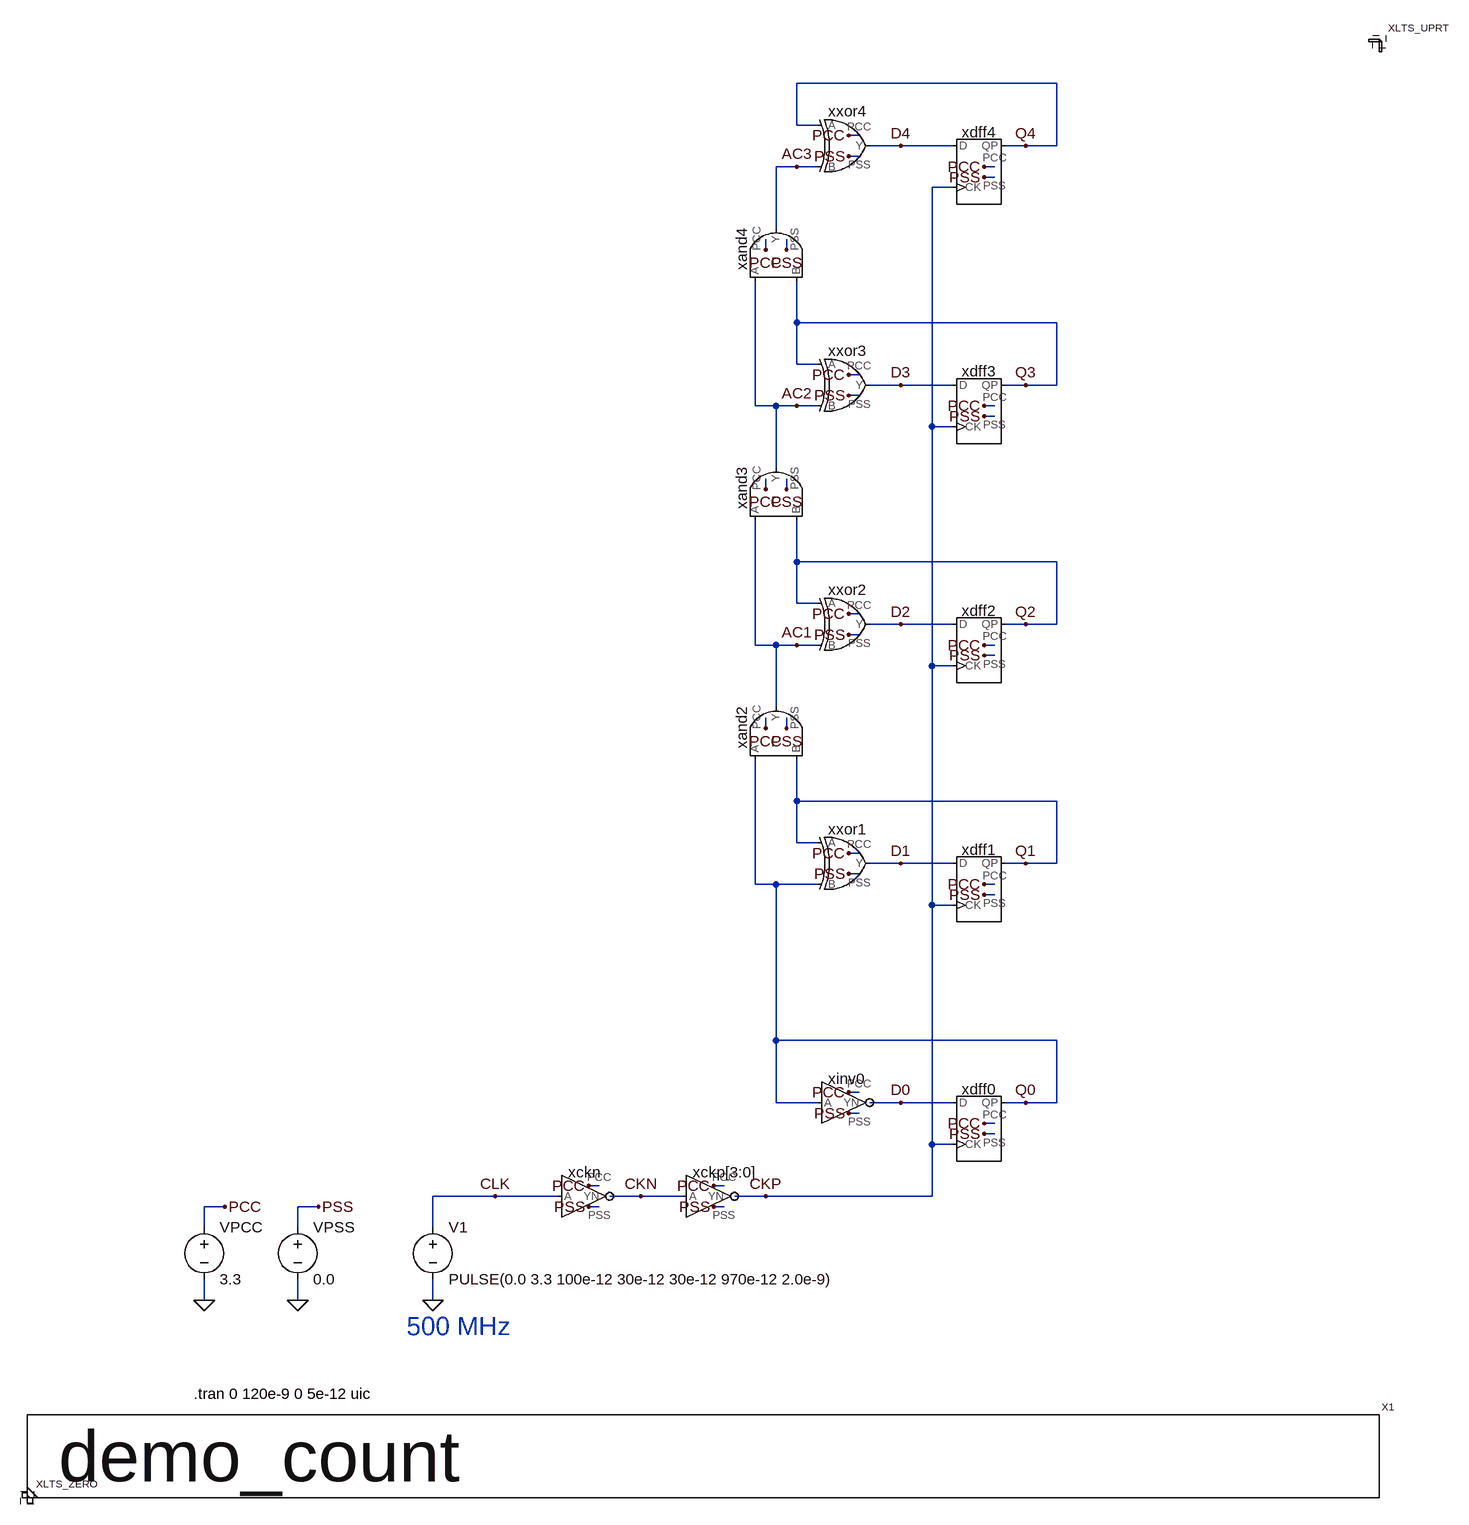
[diagram p0: schematic demo_count.asc]
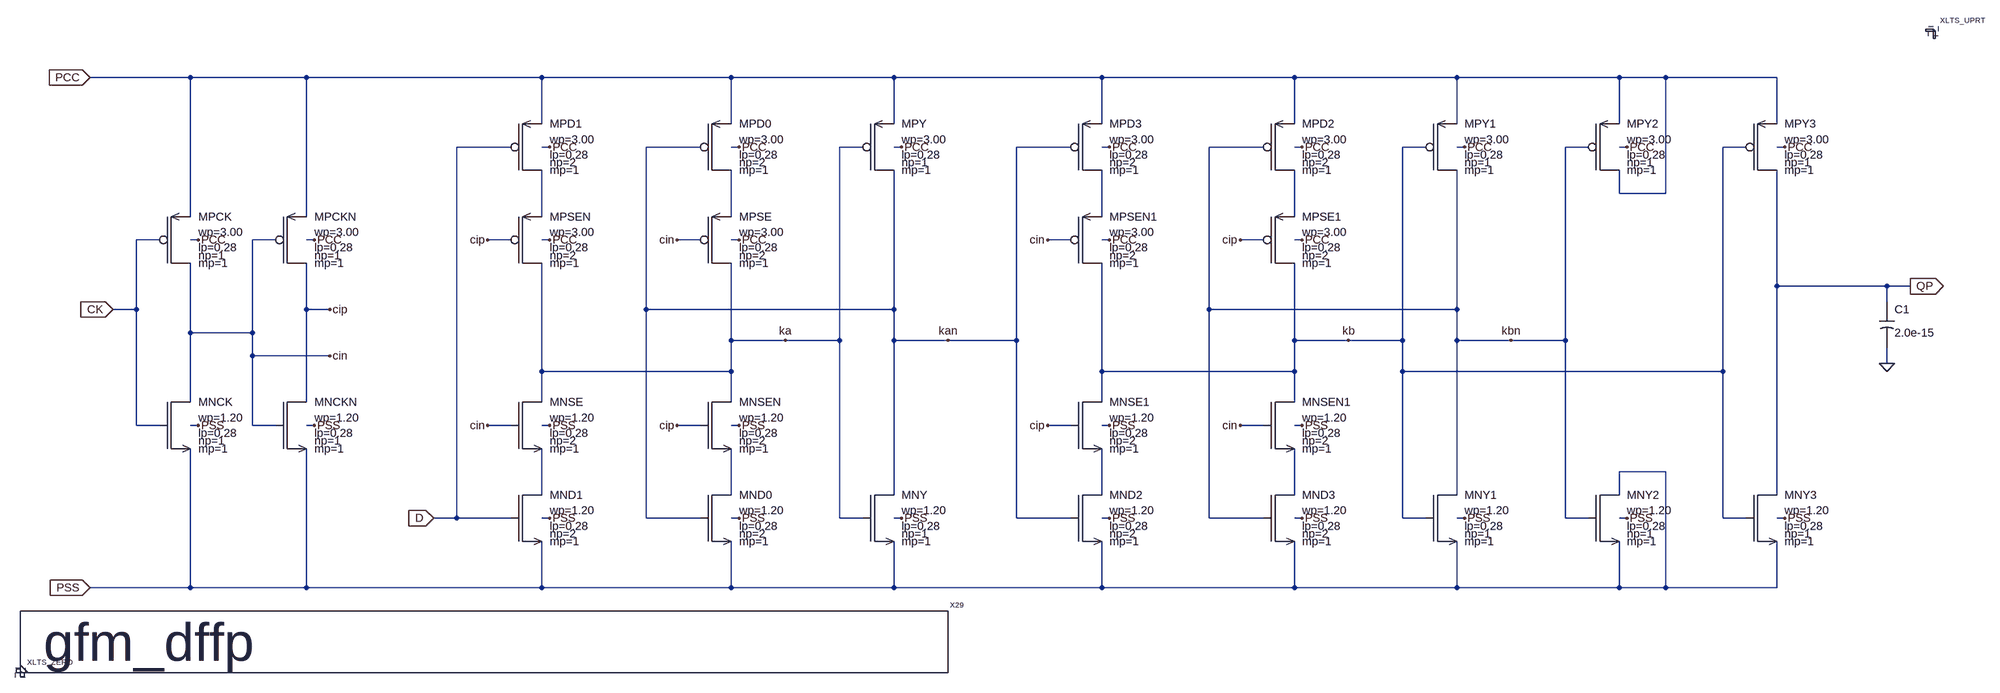
[diagram p1: sub-circuit gfm_dffp.asc]
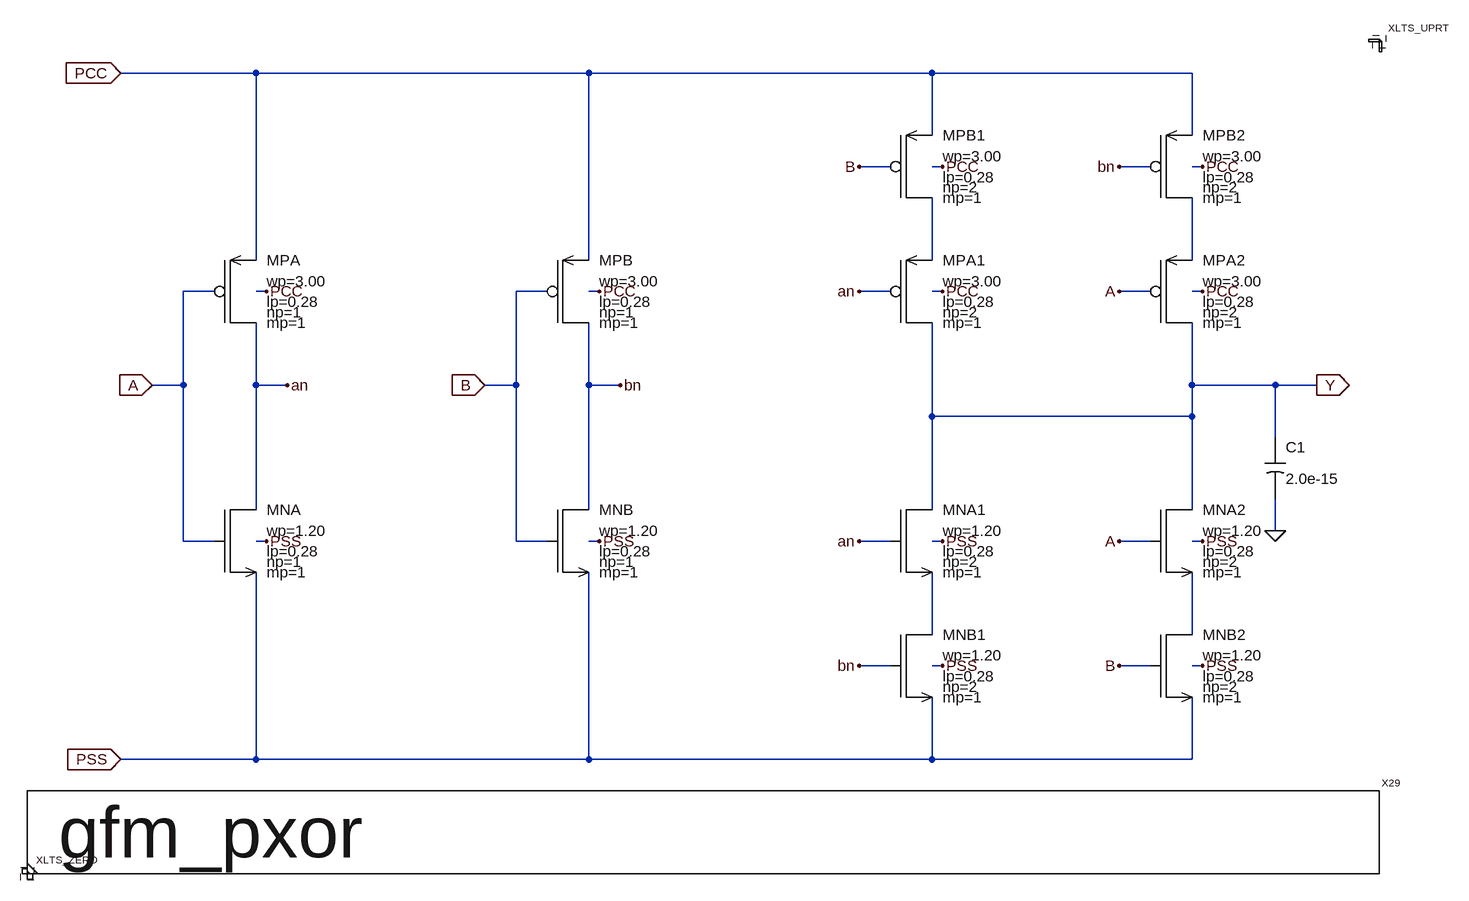
[diagram p2: sub-circuit gfm_pxor.asc]
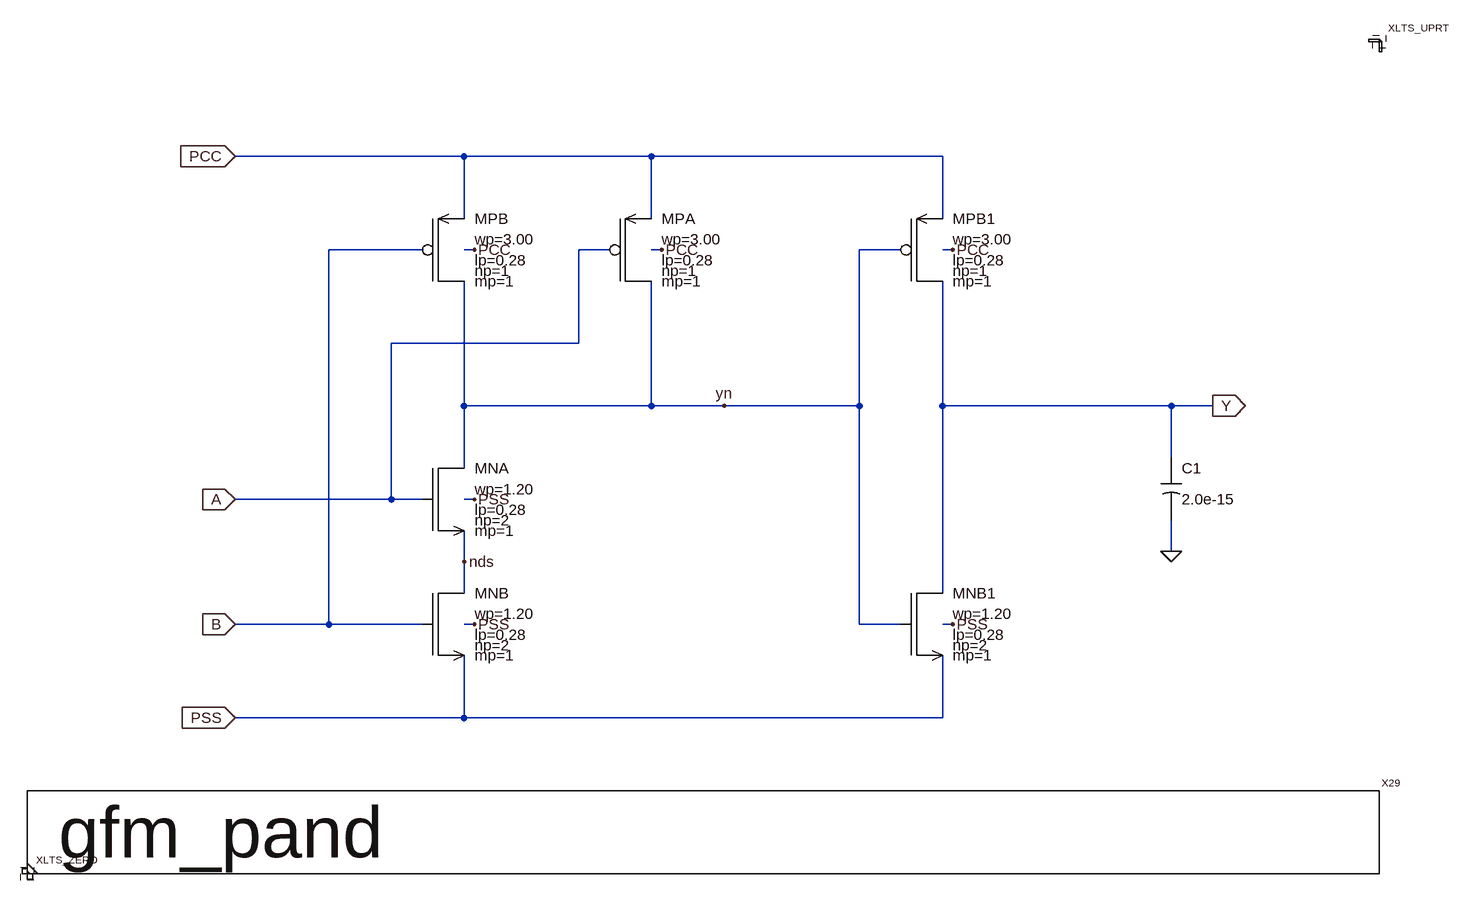
[diagram p3: sub-circuit gfm_pand.asc]
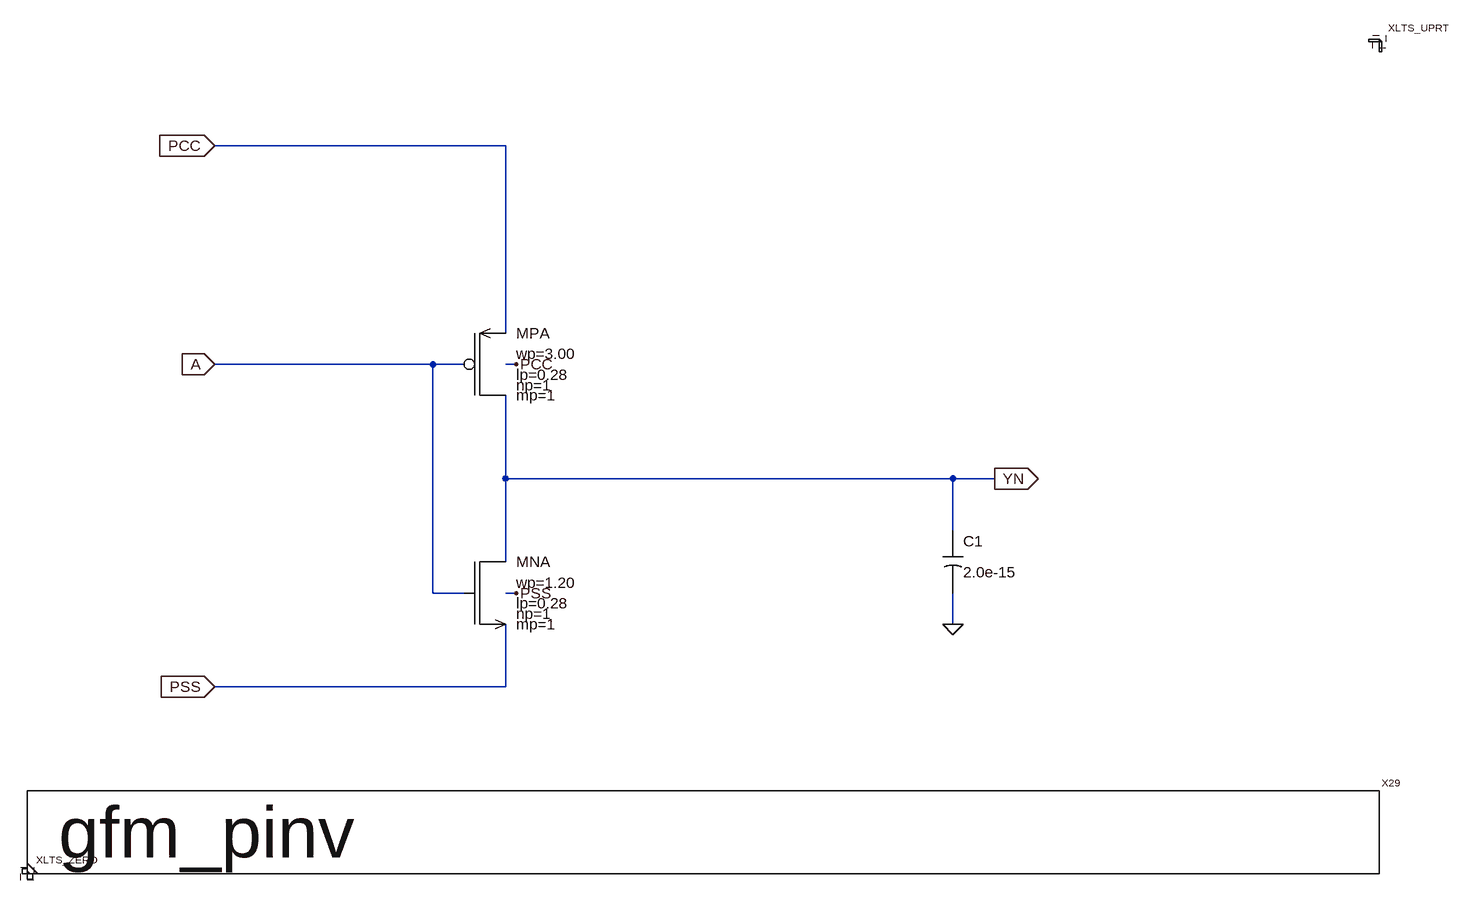
[diagram p4: sub-circuit gfm_pinv.asc]
demo_count.asc, the LTspice schematic file:
Version 4.1
SHEET 1 4824 680
WIRE 1584 -2176 1184 -2176
WIRE 1184 -2112 1184 -2176
WIRE 1216 -2112 1184 -2112
WIRE 1280 -2096 1264 -2096
WIRE 1344 -2080 1296 -2080
WIRE 1424 -2080 1344 -2080
WIRE 1536 -2080 1504 -2080
WIRE 1584 -2080 1584 -2176
WIRE 1584 -2080 1536 -2080
WIRE 1280 -2064 1264 -2064
WIRE 1184 -2048 1152 -2048
WIRE 1216 -2048 1184 -2048
WIRE 1488 -2048 1472 -2048
WIRE 1488 -2032 1472 -2032
WIRE 1424 -2016 1392 -2016
WIRE 1152 -1952 1152 -2048
WIRE 1136 -1920 1136 -1936
WIRE 1168 -1920 1168 -1936
WIRE 1184 -1808 1184 -1872
WIRE 1584 -1808 1184 -1808
WIRE 1184 -1744 1184 -1808
WIRE 1216 -1744 1184 -1744
WIRE 1280 -1728 1264 -1728
WIRE 1344 -1712 1296 -1712
WIRE 1424 -1712 1344 -1712
WIRE 1536 -1712 1504 -1712
WIRE 1584 -1712 1584 -1808
WIRE 1584 -1712 1536 -1712
WIRE 1280 -1696 1264 -1696
WIRE 1120 -1680 1120 -1872
WIRE 1152 -1680 1120 -1680
WIRE 1184 -1680 1152 -1680
WIRE 1216 -1680 1184 -1680
WIRE 1488 -1680 1472 -1680
WIRE 1488 -1664 1472 -1664
WIRE 1392 -1648 1392 -2016
WIRE 1424 -1648 1392 -1648
WIRE 1152 -1584 1152 -1680
WIRE 1136 -1552 1136 -1568
WIRE 1168 -1552 1168 -1568
WIRE 1184 -1440 1184 -1504
WIRE 1584 -1440 1184 -1440
WIRE 1184 -1376 1184 -1440
WIRE 1216 -1376 1184 -1376
WIRE 1280 -1360 1264 -1360
WIRE 1344 -1344 1296 -1344
WIRE 1424 -1344 1344 -1344
WIRE 1536 -1344 1504 -1344
WIRE 1584 -1344 1584 -1440
WIRE 1584 -1344 1536 -1344
WIRE 1280 -1328 1264 -1328
WIRE 1120 -1312 1120 -1504
WIRE 1152 -1312 1120 -1312
WIRE 1184 -1312 1152 -1312
WIRE 1216 -1312 1184 -1312
WIRE 1488 -1312 1472 -1312
WIRE 1488 -1296 1472 -1296
WIRE 1392 -1280 1392 -1648
WIRE 1424 -1280 1392 -1280
WIRE 1152 -1216 1152 -1312
WIRE 1136 -1184 1136 -1200
WIRE 1168 -1184 1168 -1200
WIRE 1184 -1072 1184 -1136
WIRE 1584 -1072 1184 -1072
WIRE 1184 -1008 1184 -1072
WIRE 1216 -1008 1184 -1008
WIRE 1280 -992 1264 -992
WIRE 1344 -976 1296 -976
WIRE 1424 -976 1344 -976
WIRE 1536 -976 1504 -976
WIRE 1584 -976 1584 -1072
WIRE 1584 -976 1536 -976
WIRE 1280 -960 1264 -960
WIRE 1120 -944 1120 -1136
WIRE 1152 -944 1120 -944
WIRE 1216 -944 1152 -944
WIRE 1488 -944 1472 -944
WIRE 1488 -928 1472 -928
WIRE 1392 -912 1392 -1280
WIRE 1424 -912 1392 -912
WIRE 1152 -704 1152 -944
WIRE 1584 -704 1152 -704
WIRE 1280 -624 1264 -624
WIRE 1152 -608 1152 -704
WIRE 1216 -608 1152 -608
WIRE 1344 -608 1296 -608
WIRE 1424 -608 1344 -608
WIRE 1536 -608 1504 -608
WIRE 1584 -608 1584 -704
WIRE 1584 -608 1536 -608
WIRE 1280 -592 1264 -592
WIRE 1488 -576 1472 -576
WIRE 1488 -560 1472 -560
WIRE 1392 -544 1392 -912
WIRE 1424 -544 1392 -544
WIRE 880 -480 864 -480
WIRE 1072 -480 1056 -480
WIRE 720 -464 624 -464
WIRE 816 -464 720 -464
WIRE 944 -464 896 -464
WIRE 1008 -464 944 -464
WIRE 1136 -464 1088 -464
WIRE 1392 -464 1392 -544
WIRE 1392 -464 1136 -464
WIRE 304 -448 272 -448
WIRE 448 -448 416 -448
WIRE 880 -448 864 -448
WIRE 1072 -448 1056 -448
WIRE 272 -416 272 -448
WIRE 416 -416 416 -448
WIRE 624 -416 624 -464
WIRE 272 -304 272 -336
WIRE 416 -304 416 -336
WIRE 624 -304 624 -336
FLAG 1472 -944 PCC
FLAG 1472 -928 PSS
FLAG 1344 -608 D0
FLAG 1536 -608 Q0
FLAG 1472 -1312 PCC
FLAG 1472 -1296 PSS
FLAG 1344 -976 D1
FLAG 1264 -1360 PCC
FLAG 1264 -1328 PSS
FLAG 1136 -1184 PCC
FLAG 1168 -1184 PSS
FLAG 1536 -976 Q1
FLAG 1472 -1680 PCC
FLAG 1472 -1664 PSS
FLAG 1344 -1344 D2
FLAG 1264 -1728 PCC
FLAG 1264 -1696 PSS
FLAG 1184 -1312 AC1
FLAG 1136 -1552 PCC
FLAG 1168 -1552 PSS
FLAG 1536 -1344 Q2
FLAG 1472 -2048 PCC
FLAG 1472 -2032 PSS
FLAG 1344 -1712 D3
FLAG 1264 -2096 PCC
FLAG 1264 -2064 PSS
FLAG 1184 -1680 AC2
FLAG 1136 -1920 PCC
FLAG 1168 -1920 PSS
FLAG 1536 -1712 Q3
FLAG 1344 -2080 D4
FLAG 1264 -992 PCC
FLAG 1264 -960 PSS
FLAG 1184 -2048 AC3
FLAG 1536 -2080 Q4
FLAG 1264 -624 PCC
FLAG 1264 -592 PSS
FLAG 1472 -576 PCC
FLAG 1472 -560 PSS
FLAG 272 -304 0
FLAG 304 -448 PCC
FLAG 416 -304 0
FLAG 448 -448 PSS
FLAG 624 -304 0
FLAG 944 -464 CKN
FLAG 864 -480 PCC
FLAG 864 -448 PSS
FLAG 1136 -464 CKP
FLAG 1056 -480 PCC
FLAG 1056 -448 PSS
FLAG 720 -464 CLK
SYMBOL BD_GTitleLTS 0 0 R0
SYMATTR SpiceModel demo_count
SYMATTR InstName X1
SYMBOL BD_ZERO 0 0 R0
SYMATTR InstName XLTS_ZERO
SYMBOL BD_UPRT 2080 -2240 R0
SYMATTR InstName XLTS_UPRT
SYMBOL gfm_dffp 1424 -944 R0
SYMATTR InstName xdff1
SYMBOL gfm_dffp 1424 -1312 R0
SYMATTR InstName xdff2
SYMBOL gfm_pxor 1216 -1344 R0
SYMATTR InstName xxor2
SYMBOL gfm_pand 1152 -1136 R270
SYMATTR InstName xand2
SYMBOL gfm_dffp 1424 -1680 R0
SYMATTR InstName xdff3
SYMBOL gfm_pxor 1216 -1712 R0
SYMATTR InstName xxor3
SYMBOL gfm_pand 1152 -1504 R270
SYMATTR InstName xand3
SYMBOL gfm_dffp 1424 -2048 R0
SYMATTR InstName xdff4
SYMBOL gfm_pxor 1216 -2080 R0
SYMATTR InstName xxor4
SYMBOL gfm_pand 1152 -1872 R270
SYMATTR InstName xand4
SYMBOL gfm_pxor 1216 -976 R0
SYMATTR InstName xxor1
SYMBOL gfm_pinv 1216 -608 R0
SYMATTR InstName xinv0
SYMBOL gfm_dffp 1424 -576 R0
SYMATTR InstName xdff0
SYMBOL voltage 272 -432 R0
SYMATTR InstName VPCC
SYMATTR Value 3.3
SYMBOL voltage 416 -432 R0
SYMATTR InstName VPSS
SYMATTR Value 0.0
SYMBOL voltage 624 -432 R0
WINDOW 123 0 0 Left 0
WINDOW 39 0 0 Left 0
SYMATTR InstName V1
SYMATTR Value PULSE(0.0 3.3 100e-12 30e-12 30e-12 970e-12 2.0e-9)
SYMBOL gfm_pinv 816 -464 R0
SYMATTR InstName xckn
SYMBOL gfm_pinv 1008 -464 R0
SYMATTR InstName xckp[3:0]
TEXT 584 -264 Left 4 ;500 MHz
TEXT 256 -160 Left 2 !.tran 0 120e-9 0 5e-12 uic

gfm_dffp.asc, the sub-circuit schematic file:
Version 4
SHEET 1 4876 4336
WIRE 352 -1232 144 -1232
WIRE 592 -1232 352 -1232
WIRE 1232 -1232 592 -1232
WIRE 1632 -1232 1232 -1232
WIRE 1968 -1232 1632 -1232
WIRE 2768 -1232 1968 -1232
WIRE 3168 -1232 2768 -1232
WIRE 3504 -1232 3168 -1232
WIRE 3840 -1232 3504 -1232
WIRE 3936 -1232 3840 -1232
WIRE 4176 -1232 3936 -1232
WIRE 1232 -1136 1232 -1232
WIRE 1632 -1136 1632 -1232
WIRE 1968 -1136 1968 -1232
WIRE 2768 -1136 2768 -1232
WIRE 3168 -1136 3168 -1232
WIRE 3504 -1136 3504 -1232
WIRE 3840 -1136 3840 -1232
WIRE 4176 -1136 4176 -1232
WIRE 1168 -1088 1056 -1088
WIRE 1248 -1088 1232 -1088
WIRE 1568 -1088 1456 -1088
WIRE 1648 -1088 1632 -1088
WIRE 1904 -1088 1856 -1088
WIRE 1984 -1088 1968 -1088
WIRE 2704 -1088 2592 -1088
WIRE 2784 -1088 2768 -1088
WIRE 3104 -1088 2992 -1088
WIRE 3184 -1088 3168 -1088
WIRE 3440 -1088 3392 -1088
WIRE 3520 -1088 3504 -1088
WIRE 3776 -1088 3728 -1088
WIRE 3856 -1088 3840 -1088
WIRE 4112 -1088 4064 -1088
WIRE 4192 -1088 4176 -1088
WIRE 3840 -992 3840 -1040
WIRE 3936 -992 3936 -1232
WIRE 3936 -992 3840 -992
WIRE 352 -944 352 -1232
WIRE 592 -944 592 -1232
WIRE 1232 -944 1232 -1040
WIRE 1632 -944 1632 -1040
WIRE 2768 -944 2768 -1040
WIRE 3168 -944 3168 -1040
WIRE 288 -896 240 -896
WIRE 368 -896 352 -896
WIRE 528 -896 480 -896
WIRE 608 -896 592 -896
WIRE 1168 -896 1120 -896
WIRE 1248 -896 1232 -896
WIRE 1568 -896 1520 -896
WIRE 1648 -896 1632 -896
WIRE 2704 -896 2656 -896
WIRE 2784 -896 2768 -896
WIRE 3104 -896 3056 -896
WIRE 3184 -896 3168 -896
WIRE 4176 -800 4176 -1040
WIRE 4560 -800 4176 -800
WIRE 4608 -800 4560 -800
WIRE 4560 -768 4560 -800
WIRE 240 -752 240 -896
WIRE 240 -752 192 -752
WIRE 592 -752 592 -848
WIRE 640 -752 592 -752
WIRE 1456 -752 1456 -1088
WIRE 1968 -752 1968 -1040
WIRE 1968 -752 1456 -752
WIRE 2992 -752 2992 -1088
WIRE 3504 -752 3504 -1040
WIRE 3504 -752 2992 -752
WIRE 352 -704 352 -848
WIRE 480 -704 480 -896
WIRE 480 -704 352 -704
WIRE 1632 -688 1632 -848
WIRE 1744 -688 1632 -688
WIRE 1856 -688 1856 -1088
WIRE 1856 -688 1744 -688
WIRE 1968 -688 1968 -752
WIRE 2080 -688 1968 -688
WIRE 2592 -688 2592 -1088
WIRE 2592 -688 2080 -688
WIRE 3168 -688 3168 -848
WIRE 3280 -688 3168 -688
WIRE 3392 -688 3392 -1088
WIRE 3392 -688 3280 -688
WIRE 3504 -688 3504 -752
WIRE 3616 -688 3504 -688
WIRE 3728 -688 3728 -1088
WIRE 3728 -688 3616 -688
WIRE 480 -656 480 -704
WIRE 640 -656 480 -656
WIRE 4560 -640 4560 -672
WIRE 1232 -624 1232 -848
WIRE 1632 -624 1632 -688
WIRE 1632 -624 1232 -624
WIRE 2768 -624 2768 -848
WIRE 3168 -624 3168 -688
WIRE 3168 -624 2768 -624
WIRE 3392 -624 3392 -688
WIRE 4064 -624 4064 -1088
WIRE 4064 -624 3392 -624
WIRE 352 -560 352 -704
WIRE 592 -560 592 -752
WIRE 1232 -560 1232 -624
WIRE 1632 -560 1632 -624
WIRE 2768 -560 2768 -624
WIRE 3168 -560 3168 -624
WIRE 240 -512 240 -752
WIRE 288 -512 240 -512
WIRE 368 -512 352 -512
WIRE 480 -512 480 -656
WIRE 528 -512 480 -512
WIRE 608 -512 592 -512
WIRE 1168 -512 1120 -512
WIRE 1248 -512 1232 -512
WIRE 1568 -512 1520 -512
WIRE 1648 -512 1632 -512
WIRE 2704 -512 2656 -512
WIRE 2784 -512 2768 -512
WIRE 3104 -512 3056 -512
WIRE 3184 -512 3168 -512
WIRE 3936 -416 3840 -416
WIRE 1232 -368 1232 -464
WIRE 1632 -368 1632 -464
WIRE 1968 -368 1968 -688
WIRE 2768 -368 2768 -464
WIRE 3168 -368 3168 -464
WIRE 3504 -368 3504 -688
WIRE 3840 -368 3840 -416
WIRE 4176 -368 4176 -800
WIRE 1056 -320 1056 -1088
WIRE 1056 -320 1008 -320
WIRE 1168 -320 1056 -320
WIRE 1248 -320 1232 -320
WIRE 1456 -320 1456 -752
WIRE 1568 -320 1456 -320
WIRE 1648 -320 1632 -320
WIRE 1856 -320 1856 -688
WIRE 1904 -320 1856 -320
WIRE 1984 -320 1968 -320
WIRE 2592 -320 2592 -688
WIRE 2704 -320 2592 -320
WIRE 2784 -320 2768 -320
WIRE 2992 -320 2992 -752
WIRE 3104 -320 2992 -320
WIRE 3184 -320 3168 -320
WIRE 3392 -320 3392 -624
WIRE 3440 -320 3392 -320
WIRE 3520 -320 3504 -320
WIRE 3728 -320 3728 -688
WIRE 3776 -320 3728 -320
WIRE 3856 -320 3840 -320
WIRE 4064 -320 4064 -624
WIRE 4112 -320 4064 -320
WIRE 4192 -320 4176 -320
WIRE 352 -176 352 -464
WIRE 352 -176 144 -176
WIRE 592 -176 592 -464
WIRE 592 -176 352 -176
WIRE 1232 -176 1232 -272
WIRE 1232 -176 592 -176
WIRE 1632 -176 1632 -272
WIRE 1632 -176 1232 -176
WIRE 1968 -176 1968 -272
WIRE 1968 -176 1632 -176
WIRE 2768 -176 2768 -272
WIRE 2768 -176 1968 -176
WIRE 3168 -176 3168 -272
WIRE 3168 -176 2768 -176
WIRE 3504 -176 3504 -272
WIRE 3504 -176 3168 -176
WIRE 3840 -176 3840 -272
WIRE 3840 -176 3504 -176
WIRE 3936 -176 3936 -416
WIRE 3936 -176 3840 -176
WIRE 4176 -176 4176 -272
WIRE 4176 -176 3936 -176
FLAG 144 -176 PSS
IOPIN 144 -176 In
FLAG 144 -1232 PCC
IOPIN 144 -1232 In
FLAG 192 -752 CK
IOPIN 192 -752 In
FLAG 1008 -320 D
IOPIN 1008 -320 In
FLAG 1648 -512 PSS
FLAG 1520 -512 cip
FLAG 1248 -512 PSS
FLAG 1120 -512 cin
FLAG 1648 -896 PCC
FLAG 1520 -896 cin
FLAG 1248 -896 PCC
FLAG 1120 -896 cip
FLAG 1648 -1088 PCC
FLAG 1248 -1088 PCC
FLAG 1648 -320 PSS
FLAG 1248 -320 PSS
FLAG 368 -512 PSS
FLAG 368 -896 PCC
FLAG 608 -512 PSS
FLAG 608 -896 PCC
FLAG 640 -752 cip
FLAG 640 -656 cin
FLAG 1984 -1088 PCC
FLAG 1984 -320 PSS
FLAG 1744 -688 ka
FLAG 3184 -512 PSS
FLAG 3056 -512 cin
FLAG 2784 -512 PSS
FLAG 2656 -512 cip
FLAG 3184 -896 PCC
FLAG 3056 -896 cip
FLAG 2784 -896 PCC
FLAG 2656 -896 cin
FLAG 3184 -1088 PCC
FLAG 2784 -1088 PCC
FLAG 3184 -320 PSS
FLAG 2784 -320 PSS
FLAG 3520 -1088 PCC
FLAG 3520 -320 PSS
FLAG 3280 -688 kb
FLAG 2080 -688 kan
FLAG 3856 -1088 PCC
FLAG 3856 -320 PSS
FLAG 4192 -1088 PCC
FLAG 4192 -320 PSS
FLAG 3616 -688 kbn
FLAG 4608 -800 QP
IOPIN 4608 -800 Out
FLAG 4560 -640 0
SYMBOL gfmcu_nmos3p3 1168 -512 R0
SYMATTR InstName MNSE
SYMATTR SpiceLine np=2
SYMATTR Value wp=1.20
SYMATTR Value2 lp=0.28
SYMBOL gfmcu_nmos3p3 1168 -320 R0
SYMATTR InstName MND1
SYMATTR SpiceLine np=2
SYMATTR Value wp=1.20
SYMATTR Value2 lp=0.28
SYMBOL gfmcu_pmos3p3 1568 -896 R0
SYMATTR InstName MPSE
SYMATTR SpiceLine np=2
SYMATTR Value wp=3.00
SYMATTR Value2 lp=0.28
SYMBOL gfmcu_pmos3p3 1568 -1088 R0
SYMATTR InstName MPD0
SYMATTR SpiceLine np=2
SYMATTR Value wp=3.00
SYMATTR Value2 lp=0.28
SYMBOL gfmcu_pmos3p3 1168 -896 R0
SYMATTR InstName MPSEN
SYMATTR SpiceLine np=2
SYMATTR Value wp=3.00
SYMATTR Value2 lp=0.28
SYMBOL gfmcu_pmos3p3 1168 -1088 R0
SYMATTR InstName MPD1
SYMATTR SpiceLine np=2
SYMATTR Value wp=3.00
SYMATTR Value2 lp=0.28
SYMBOL BD_GTitleLTS 0 0 R0
SYMATTR InstName X29
SYMATTR SpiceModel gfm_dffp
SYMBOL gfmcu_nmos3p3 1568 -512 R0
SYMATTR InstName MNSEN
SYMATTR SpiceLine np=2
SYMATTR Value wp=1.20
SYMATTR Value2 lp=0.28
SYMBOL gfmcu_nmos3p3 1568 -320 R0
SYMATTR InstName MND0
SYMATTR SpiceLine np=2
SYMATTR Value wp=1.20
SYMATTR Value2 lp=0.28
SYMBOL gfmcu_nmos3p3 288 -512 R0
SYMATTR InstName MNCK
SYMATTR Value wp=1.20
SYMATTR Value2 lp=0.28
SYMBOL gfmcu_pmos3p3 288 -896 R0
SYMATTR InstName MPCK
SYMATTR Value wp=3.00
SYMATTR Value2 lp=0.28
SYMBOL gfmcu_nmos3p3 528 -512 R0
SYMATTR InstName MNCKN
SYMATTR Value wp=1.20
SYMATTR Value2 lp=0.28
SYMBOL gfmcu_pmos3p3 528 -896 R0
SYMATTR InstName MPCKN
SYMATTR Value wp=3.00
SYMATTR Value2 lp=0.28
SYMBOL gfmcu_pmos3p3 1904 -1088 R0
SYMATTR InstName MPY
SYMATTR Value wp=3.00
SYMATTR Value2 lp=0.28
SYMBOL gfmcu_nmos3p3 1904 -320 R0
SYMATTR InstName MNY
SYMATTR Value wp=1.20
SYMATTR Value2 lp=0.28
SYMBOL gfmcu_nmos3p3 2704 -512 R0
SYMATTR InstName MNSE1
SYMATTR SpiceLine np=2
SYMATTR Value wp=1.20
SYMATTR Value2 lp=0.28
SYMBOL gfmcu_nmos3p3 2704 -320 R0
SYMATTR InstName MND2
SYMATTR SpiceLine np=2
SYMATTR Value wp=1.20
SYMATTR Value2 lp=0.28
SYMBOL gfmcu_pmos3p3 3104 -896 R0
SYMATTR InstName MPSE1
SYMATTR SpiceLine np=2
SYMATTR Value wp=3.00
SYMATTR Value2 lp=0.28
SYMBOL gfmcu_pmos3p3 3104 -1088 R0
SYMATTR InstName MPD2
SYMATTR SpiceLine np=2
SYMATTR Value wp=3.00
SYMATTR Value2 lp=0.28
SYMBOL gfmcu_pmos3p3 2704 -896 R0
SYMATTR InstName MPSEN1
SYMATTR SpiceLine np=2
SYMATTR Value wp=3.00
SYMATTR Value2 lp=0.28
SYMBOL gfmcu_pmos3p3 2704 -1088 R0
SYMATTR InstName MPD3
SYMATTR SpiceLine np=2
SYMATTR Value wp=3.00
SYMATTR Value2 lp=0.28
SYMBOL gfmcu_nmos3p3 3104 -512 R0
SYMATTR InstName MNSEN1
SYMATTR SpiceLine np=2
SYMATTR Value wp=1.20
SYMATTR Value2 lp=0.28
SYMBOL gfmcu_nmos3p3 3104 -320 R0
SYMATTR InstName MND3
SYMATTR SpiceLine np=2
SYMATTR Value wp=1.20
SYMATTR Value2 lp=0.28
SYMBOL gfmcu_pmos3p3 3440 -1088 R0
SYMATTR InstName MPY1
SYMATTR Value wp=3.00
SYMATTR Value2 lp=0.28
SYMBOL gfmcu_nmos3p3 3440 -320 R0
SYMATTR InstName MNY1
SYMATTR Value wp=1.20
SYMATTR Value2 lp=0.28
SYMBOL gfmcu_pmos3p3 3776 -1088 R0
SYMATTR InstName MPY2
SYMATTR Value wp=3.00
SYMATTR Value2 lp=0.28
SYMBOL gfmcu_nmos3p3 3776 -320 R0
SYMATTR InstName MNY2
SYMATTR Value wp=1.20
SYMATTR Value2 lp=0.28
SYMBOL gfmcu_pmos3p3 4112 -1088 R0
SYMATTR InstName MPY3
SYMATTR Value wp=3.00
SYMATTR Value2 lp=0.28
SYMBOL gfmcu_nmos3p3 4112 -320 R0
SYMATTR InstName MNY3
SYMATTR Value wp=1.20
SYMATTR Value2 lp=0.28
SYMBOL gcap 4560 -768 R0
SYMATTR InstName C1
SYMATTR Value 2.0e-15
SYMBOL BD_ZERO 0 0 R0
SYMATTR InstName XLTS_ZERO
SYMBOL BD_UPRT 4656 -1328 R0
SYMATTR InstName XLTS_UPRT

gfm_pxor.asc, the sub-circuit schematic file:
Version 4
SHEET 1 4552 4336
WIRE 352 -1232 144 -1232
WIRE 864 -1232 352 -1232
WIRE 1392 -1232 864 -1232
WIRE 1792 -1232 1392 -1232
WIRE 1392 -1136 1392 -1232
WIRE 1792 -1136 1792 -1232
WIRE 1328 -1088 1280 -1088
WIRE 1408 -1088 1392 -1088
WIRE 1728 -1088 1680 -1088
WIRE 1808 -1088 1792 -1088
WIRE 352 -944 352 -1232
WIRE 864 -944 864 -1232
WIRE 1392 -944 1392 -1040
WIRE 1792 -944 1792 -1040
WIRE 288 -896 240 -896
WIRE 368 -896 352 -896
WIRE 800 -896 752 -896
WIRE 880 -896 864 -896
WIRE 1328 -896 1280 -896
WIRE 1408 -896 1392 -896
WIRE 1728 -896 1680 -896
WIRE 1808 -896 1792 -896
WIRE 240 -752 240 -896
WIRE 240 -752 192 -752
WIRE 352 -752 352 -848
WIRE 400 -752 352 -752
WIRE 752 -752 752 -896
WIRE 752 -752 704 -752
WIRE 864 -752 864 -848
WIRE 912 -752 864 -752
WIRE 1792 -752 1792 -848
WIRE 1920 -752 1792 -752
WIRE 1984 -752 1920 -752
WIRE 1392 -704 1392 -848
WIRE 1792 -704 1792 -752
WIRE 1792 -704 1392 -704
WIRE 1920 -672 1920 -752
WIRE 352 -560 352 -752
WIRE 864 -560 864 -752
WIRE 1392 -560 1392 -704
WIRE 1792 -560 1792 -704
WIRE 1920 -528 1920 -576
WIRE 240 -512 240 -752
WIRE 288 -512 240 -512
WIRE 368 -512 352 -512
WIRE 752 -512 752 -752
WIRE 800 -512 752 -512
WIRE 880 -512 864 -512
WIRE 1328 -512 1280 -512
WIRE 1408 -512 1392 -512
WIRE 1728 -512 1680 -512
WIRE 1808 -512 1792 -512
WIRE 1392 -368 1392 -464
WIRE 1792 -368 1792 -464
WIRE 1328 -320 1280 -320
WIRE 1408 -320 1392 -320
WIRE 1728 -320 1680 -320
WIRE 1808 -320 1792 -320
WIRE 352 -176 352 -464
WIRE 352 -176 144 -176
WIRE 864 -176 864 -464
WIRE 864 -176 352 -176
WIRE 1392 -176 1392 -272
WIRE 1392 -176 864 -176
WIRE 1792 -176 1792 -272
WIRE 1792 -176 1392 -176
FLAG 144 -176 PSS
IOPIN 144 -176 In
FLAG 144 -1232 PCC
IOPIN 144 -1232 In
FLAG 192 -752 A
IOPIN 192 -752 In
FLAG 1984 -752 Y
IOPIN 1984 -752 Out
FLAG 1920 -528 0
FLAG 1808 -512 PSS
FLAG 1280 -512 an
FLAG 1408 -512 PSS
FLAG 1680 -512 A
FLAG 1808 -896 PCC
FLAG 1280 -896 an
FLAG 1408 -896 PCC
FLAG 1680 -896 A
FLAG 1808 -1088 PCC
FLAG 1408 -1088 PCC
FLAG 1808 -320 PSS
FLAG 1408 -320 PSS
FLAG 368 -512 PSS
FLAG 368 -896 PCC
FLAG 880 -512 PSS
FLAG 880 -896 PCC
FLAG 400 -752 an
FLAG 704 -752 B
IOPIN 704 -752 In
FLAG 912 -752 bn
FLAG 1280 -1088 B
FLAG 1280 -320 bn
FLAG 1680 -320 B
FLAG 1680 -1088 bn
SYMBOL gfmcu_nmos3p3 1328 -512 R0
SYMATTR InstName MNA1
SYMATTR SpiceLine np=2
SYMATTR Value wp=1.20
SYMATTR Value2 lp=0.28
SYMBOL gfmcu_nmos3p3 1328 -320 R0
SYMATTR InstName MNB1
SYMATTR SpiceLine np=2
SYMATTR Value wp=1.20
SYMATTR Value2 lp=0.28
SYMBOL gcap 1920 -672 R0
SYMATTR InstName C1
SYMATTR Value 2.0e-15
SYMBOL gfmcu_pmos3p3 1728 -896 R0
SYMATTR InstName MPA2
SYMATTR SpiceLine np=2
SYMATTR Value wp=3.00
SYMATTR Value2 lp=0.28
SYMBOL gfmcu_pmos3p3 1728 -1088 R0
SYMATTR InstName MPB2
SYMATTR SpiceLine np=2
SYMATTR Value wp=3.00
SYMATTR Value2 lp=0.28
SYMBOL gfmcu_pmos3p3 1328 -896 R0
SYMATTR InstName MPA1
SYMATTR SpiceLine np=2
SYMATTR Value wp=3.00
SYMATTR Value2 lp=0.28
SYMBOL gfmcu_pmos3p3 1328 -1088 R0
SYMATTR InstName MPB1
SYMATTR SpiceLine np=2
SYMATTR Value wp=3.00
SYMATTR Value2 lp=0.28
SYMBOL BD_GTitleLTS 0 0 R0
SYMATTR InstName X29
SYMATTR SpiceModel gfm_pxor
SYMBOL gfmcu_nmos3p3 1728 -512 R0
SYMATTR InstName MNA2
SYMATTR SpiceLine np=2
SYMATTR Value wp=1.20
SYMATTR Value2 lp=0.28
SYMBOL gfmcu_nmos3p3 1728 -320 R0
SYMATTR InstName MNB2
SYMATTR SpiceLine np=2
SYMATTR Value wp=1.20
SYMATTR Value2 lp=0.28
SYMBOL gfmcu_nmos3p3 288 -512 R0
SYMATTR InstName MNA
SYMATTR Value wp=1.20
SYMATTR Value2 lp=0.28
SYMBOL gfmcu_pmos3p3 288 -896 R0
SYMATTR InstName MPA
SYMATTR Value wp=3.00
SYMATTR Value2 lp=0.28
SYMBOL gfmcu_nmos3p3 800 -512 R0
SYMATTR InstName MNB
SYMATTR Value wp=1.20
SYMATTR Value2 lp=0.28
SYMBOL gfmcu_pmos3p3 800 -896 R0
SYMATTR InstName MPB
SYMATTR Value wp=3.00
SYMATTR Value2 lp=0.28
SYMBOL BD_ZERO 0 0 R0
SYMATTR InstName XLTS_ZERO
SYMBOL BD_UPRT 2080 -1280 R0
SYMATTR InstName XLTS_UPRT

gfm_pand.asc, the sub-circuit schematic file:
Version 4
SHEET 1 4552 4336
WIRE 672 -1104 320 -1104
WIRE 960 -1104 672 -1104
WIRE 1408 -1104 960 -1104
WIRE 672 -1008 672 -1104
WIRE 960 -1008 960 -1104
WIRE 1408 -1008 1408 -1104
WIRE 608 -960 464 -960
WIRE 688 -960 672 -960
WIRE 896 -960 848 -960
WIRE 976 -960 960 -960
WIRE 1344 -960 1280 -960
WIRE 1424 -960 1408 -960
WIRE 848 -816 848 -960
WIRE 848 -816 560 -816
WIRE 672 -720 672 -912
WIRE 960 -720 960 -912
WIRE 960 -720 672 -720
WIRE 1072 -720 960 -720
WIRE 1280 -720 1280 -960
WIRE 1280 -720 1072 -720
WIRE 1408 -720 1408 -912
WIRE 1760 -720 1408 -720
WIRE 1824 -720 1760 -720
WIRE 1760 -640 1760 -720
WIRE 672 -624 672 -720
WIRE 560 -576 560 -816
WIRE 560 -576 320 -576
WIRE 608 -576 560 -576
WIRE 688 -576 672 -576
WIRE 1760 -496 1760 -544
WIRE 672 -480 672 -528
WIRE 672 -432 672 -480
WIRE 1408 -432 1408 -720
WIRE 464 -384 464 -960
WIRE 464 -384 320 -384
WIRE 608 -384 464 -384
WIRE 688 -384 672 -384
WIRE 1280 -384 1280 -720
WIRE 1344 -384 1280 -384
WIRE 1424 -384 1408 -384
WIRE 672 -240 672 -336
WIRE 672 -240 320 -240
WIRE 1408 -240 1408 -336
WIRE 1408 -240 672 -240
FLAG 320 -240 PSS
IOPIN 320 -240 In
FLAG 320 -384 B
IOPIN 320 -384 In
FLAG 320 -576 A
IOPIN 320 -576 In
FLAG 320 -1104 PCC
IOPIN 320 -1104 In
FLAG 1824 -720 Y
IOPIN 1824 -720 Out
FLAG 1760 -496 0
FLAG 688 -384 PSS
FLAG 976 -960 PCC
FLAG 688 -960 PCC
FLAG 688 -576 PSS
FLAG 672 -480 nds
FLAG 1424 -384 PSS
FLAG 1424 -960 PCC
FLAG 1072 -720 yn
SYMBOL BD_GTitleLTS 0 0 R0
SYMATTR InstName X29
SYMATTR SpiceModel gfm_pand
SYMBOL gfmcu_pmos3p3 896 -960 R0
SYMATTR InstName MPA
SYMATTR Value wp=3.00
SYMATTR Value2 lp=0.28
SYMBOL gfmcu_pmos3p3 608 -960 R0
SYMATTR InstName MPB
SYMATTR Value wp=3.00
SYMATTR Value2 lp=0.28
SYMBOL gfmcu_nmos3p3 608 -576 R0
SYMATTR InstName MNA
SYMATTR SpiceLine np=2
SYMATTR Value wp=1.20
SYMATTR Value2 lp=0.28
SYMBOL gfmcu_nmos3p3 608 -384 R0
SYMATTR InstName MNB
SYMATTR SpiceLine np=2
SYMATTR Value wp=1.20
SYMATTR Value2 lp=0.28
SYMBOL gcap 1760 -640 R0
SYMATTR InstName C1
SYMATTR Value 2.0e-15
SYMBOL gfmcu_pmos3p3 1344 -960 R0
SYMATTR InstName MPB1
SYMATTR Value wp=3.00
SYMATTR Value2 lp=0.28
SYMBOL gfmcu_nmos3p3 1344 -384 R0
SYMATTR InstName MNB1
SYMATTR SpiceLine np=2
SYMATTR Value wp=1.20
SYMATTR Value2 lp=0.28
SYMBOL BD_ZERO 0 0 R0
SYMATTR InstName XLTS_ZERO
SYMBOL BD_UPRT 2080 -1280 R0
SYMATTR InstName XLTS_UPRT

gfm_pinv.asc, the sub-circuit schematic file:
Version 4
SHEET 1 4552 4336
WIRE 736 -1120 288 -1120
WIRE 736 -832 736 -1120
WIRE 624 -784 288 -784
WIRE 672 -784 624 -784
WIRE 752 -784 736 -784
WIRE 736 -608 736 -736
WIRE 1424 -608 736 -608
WIRE 1488 -608 1424 -608
WIRE 1424 -528 1424 -608
WIRE 736 -480 736 -608
WIRE 624 -432 624 -784
WIRE 672 -432 624 -432
WIRE 752 -432 736 -432
WIRE 1424 -384 1424 -432
WIRE 736 -288 736 -384
WIRE 736 -288 288 -288
FLAG 288 -288 PSS
IOPIN 288 -288 In
FLAG 288 -784 A
IOPIN 288 -784 In
FLAG 288 -1120 PCC
IOPIN 288 -1120 In
FLAG 1488 -608 YN
IOPIN 1488 -608 Out
FLAG 1424 -384 0
FLAG 752 -784 PCC
FLAG 752 -432 PSS
SYMBOL BD_GTitleLTS 0 0 R0
SYMATTR InstName X29
SYMATTR SpiceModel gfm_pinv
SYMBOL gcap 1424 -528 R0
SYMATTR InstName C1
SYMATTR Value 2.0e-15
SYMBOL gfmcu_pmos3p3 672 -784 R0
SYMATTR InstName MPA
SYMATTR Value wp=3.00
SYMATTR Value2 lp=0.28
SYMBOL gfmcu_nmos3p3 672 -432 R0
SYMATTR InstName MNA
SYMATTR Value wp=1.20
SYMATTR Value2 lp=0.28
SYMBOL BD_ZERO 0 0 R0
SYMATTR InstName XLTS_ZERO
SYMBOL BD_UPRT 2080 -1280 R0
SYMATTR InstName XLTS_UPRT

The netlist it stands for:
* demo_count.asc
X§X1 BD_GTitleLTS
X§XLTS_ZERO BD_ZERO
X§XLTS_UPRT BD_UPRT
X§xdff1 Q1 D1 CKP PCC PSS gfm_dffp
X§xdff2 Q2 D2 CKP PCC PSS gfm_dffp
X§xxor2 D2 Q2 AC1 PCC PSS gfm_pxor
X§xand2 AC1 Q0 Q1 PCC PSS gfm_pand
X§xdff3 Q3 D3 CKP PCC PSS gfm_dffp
X§xxor3 D3 Q3 AC2 PCC PSS gfm_pxor
X§xand3 AC2 AC1 Q2 PCC PSS gfm_pand
X§xdff4 Q4 D4 CKP PCC PSS gfm_dffp
X§xxor4 D4 Q4 AC3 PCC PSS gfm_pxor
X§xand4 AC3 AC2 Q3 PCC PSS gfm_pand
X§xxor1 D1 Q1 Q0 PCC PSS gfm_pxor
X§xinv0 D0 Q0 PCC PSS gfm_pinv
X§xdff0 Q0 D0 CKP PCC PSS gfm_dffp
VPCC PCC 0 3.3
VPSS PSS 0 0.0
V1 CLK 0 PULSE(0.0 3.3 100e-12 30e-12 30e-12 970e-12 2.0e-9)
X§xckn CKN CLK PCC PSS gfm_pinv
X§xckp[3:0] CKP CKN PCC PSS gfm_pinv

* block symbol definitions
.subckt gfm_dffp QP D CK PCC PSS
XMNSE ka cin N005 PSS gfmcu_nmos3p3 wp=1.20 lp=0.28 np=2 mp=1  ; pins ND NG NS NB
XMND1 N005 D PSS PSS gfmcu_nmos3p3 wp=1.20 lp=0.28 np=2 mp=1  ; pins ND NG NS NB
XMPSE ka cin N002 PCC gfmcu_pmos3p3 wp=3.00 lp=0.28 np=2 mp=1  ; pins ND NG NS NB
XMPD0 N002 kan PCC PCC gfmcu_pmos3p3 wp=3.00 lp=0.28 np=2 mp=1  ; pins ND NG NS NB
XMPSEN ka cip N001 PCC gfmcu_pmos3p3 wp=3.00 lp=0.28 np=2 mp=1  ; pins ND NG NS NB
XMPD1 N001 D PCC PCC gfmcu_pmos3p3 wp=3.00 lp=0.28 np=2 mp=1  ; pins ND NG NS NB
XX29 BD_GTitleLTS
XMNSEN ka cip N006 PSS gfmcu_nmos3p3 wp=1.20 lp=0.28 np=2 mp=1  ; pins ND NG NS NB
XMND0 N006 kan PSS PSS gfmcu_nmos3p3 wp=1.20 lp=0.28 np=2 mp=1  ; pins ND NG NS NB
XMNCK cin CK PSS PSS gfmcu_nmos3p3 wp=1.20 lp=0.28 np=1 mp=1  ; pins ND NG NS NB
XMPCK cin CK PCC PCC gfmcu_pmos3p3 wp=3.00 lp=0.28 np=1 mp=1  ; pins ND NG NS NB
XMNCKN cip cin PSS PSS gfmcu_nmos3p3 wp=1.20 lp=0.28 np=1 mp=1  ; pins ND NG NS NB
XMPCKN cip cin PCC PCC gfmcu_pmos3p3 wp=3.00 lp=0.28 np=1 mp=1  ; pins ND NG NS NB
XMPY kan ka PCC PCC gfmcu_pmos3p3 wp=3.00 lp=0.28 np=1 mp=1  ; pins ND NG NS NB
XMNY kan ka PSS PSS gfmcu_nmos3p3 wp=1.20 lp=0.28 np=1 mp=1  ; pins ND NG NS NB
XMNSE1 kb cip N007 PSS gfmcu_nmos3p3 wp=1.20 lp=0.28 np=2 mp=1  ; pins ND NG NS NB
XMND2 N007 kan PSS PSS gfmcu_nmos3p3 wp=1.20 lp=0.28 np=2 mp=1  ; pins ND NG NS NB
XMPSE1 kb cip N004 PCC gfmcu_pmos3p3 wp=3.00 lp=0.28 np=2 mp=1  ; pins ND NG NS NB
XMPD2 N004 kbn PCC PCC gfmcu_pmos3p3 wp=3.00 lp=0.28 np=2 mp=1  ; pins ND NG NS NB
XMPSEN1 kb cin N003 PCC gfmcu_pmos3p3 wp=3.00 lp=0.28 np=2 mp=1  ; pins ND NG NS NB
XMPD3 N003 kan PCC PCC gfmcu_pmos3p3 wp=3.00 lp=0.28 np=2 mp=1  ; pins ND NG NS NB
XMNSEN1 kb cin N008 PSS gfmcu_nmos3p3 wp=1.20 lp=0.28 np=2 mp=1  ; pins ND NG NS NB
XMND3 N008 kbn PSS PSS gfmcu_nmos3p3 wp=1.20 lp=0.28 np=2 mp=1  ; pins ND NG NS NB
XMPY1 kbn kb PCC PCC gfmcu_pmos3p3 wp=3.00 lp=0.28 np=1 mp=1  ; pins ND NG NS NB
XMNY1 kbn kb PSS PSS gfmcu_nmos3p3 wp=1.20 lp=0.28 np=1 mp=1  ; pins ND NG NS NB
XMPY2 PCC kbn PCC PCC gfmcu_pmos3p3 wp=3.00 lp=0.28 np=1 mp=1  ; pins ND NG NS NB
XMNY2 PSS kbn PSS PSS gfmcu_nmos3p3 wp=1.20 lp=0.28 np=1 mp=1  ; pins ND NG NS NB
XMPY3 QP kb PCC PCC gfmcu_pmos3p3 wp=3.00 lp=0.28 np=1 mp=1  ; pins ND NG NS NB
XMNY3 QP kb PSS PSS gfmcu_nmos3p3 wp=1.20 lp=0.28 np=1 mp=1  ; pins ND NG NS NB
C1 QP 0 2.0e-15
XXLTS_ZERO BD_ZERO
XXLTS_UPRT BD_UPRT
.ends gfm_dffp

.subckt gfm_pxor Y A B PCC PSS
XMNA1 Y an N003 PSS gfmcu_nmos3p3 wp=1.20 lp=0.28 np=2 mp=1  ; pins ND NG NS NB
XMNB1 N003 bn PSS PSS gfmcu_nmos3p3 wp=1.20 lp=0.28 np=2 mp=1  ; pins ND NG NS NB
C1 Y 0 2.0e-15
XMPA2 Y A N002 PCC gfmcu_pmos3p3 wp=3.00 lp=0.28 np=2 mp=1  ; pins ND NG NS NB
XMPB2 N002 bn PCC PCC gfmcu_pmos3p3 wp=3.00 lp=0.28 np=2 mp=1  ; pins ND NG NS NB
XMPA1 Y an N001 PCC gfmcu_pmos3p3 wp=3.00 lp=0.28 np=2 mp=1  ; pins ND NG NS NB
XMPB1 N001 B PCC PCC gfmcu_pmos3p3 wp=3.00 lp=0.28 np=2 mp=1  ; pins ND NG NS NB
XX29 BD_GTitleLTS
XMNA2 Y A N004 PSS gfmcu_nmos3p3 wp=1.20 lp=0.28 np=2 mp=1  ; pins ND NG NS NB
XMNB2 N004 B PSS PSS gfmcu_nmos3p3 wp=1.20 lp=0.28 np=2 mp=1  ; pins ND NG NS NB
XMNA an A PSS PSS gfmcu_nmos3p3 wp=1.20 lp=0.28 np=1 mp=1  ; pins ND NG NS NB
XMPA an A PCC PCC gfmcu_pmos3p3 wp=3.00 lp=0.28 np=1 mp=1  ; pins ND NG NS NB
XMNB bn B PSS PSS gfmcu_nmos3p3 wp=1.20 lp=0.28 np=1 mp=1  ; pins ND NG NS NB
XMPB bn B PCC PCC gfmcu_pmos3p3 wp=3.00 lp=0.28 np=1 mp=1  ; pins ND NG NS NB
XXLTS_ZERO BD_ZERO
XXLTS_UPRT BD_UPRT
.ends gfm_pxor

.subckt gfm_pand Y A B PCC PSS
XX29 BD_GTitleLTS
XMPA yn A PCC PCC gfmcu_pmos3p3 wp=3.00 lp=0.28 np=1 mp=1  ; pins ND NG NS NB
XMPB yn B PCC PCC gfmcu_pmos3p3 wp=3.00 lp=0.28 np=1 mp=1  ; pins ND NG NS NB
XMNA yn A nds PSS gfmcu_nmos3p3 wp=1.20 lp=0.28 np=2 mp=1  ; pins ND NG NS NB
XMNB nds B PSS PSS gfmcu_nmos3p3 wp=1.20 lp=0.28 np=2 mp=1  ; pins ND NG NS NB
C1 Y 0 2.0e-15
XMPB1 Y yn PCC PCC gfmcu_pmos3p3 wp=3.00 lp=0.28 np=1 mp=1  ; pins ND NG NS NB
XMNB1 Y yn PSS PSS gfmcu_nmos3p3 wp=1.20 lp=0.28 np=2 mp=1  ; pins ND NG NS NB
XXLTS_ZERO BD_ZERO
XXLTS_UPRT BD_UPRT
.ends gfm_pand

.subckt gfm_pinv YN A PCC PSS
XX29 BD_GTitleLTS
C1 YN 0 2.0e-15
XMPA YN A PCC PCC gfmcu_pmos3p3 wp=3.00 lp=0.28 np=1 mp=1  ; pins ND NG NS NB
XMNA YN A PSS PSS gfmcu_nmos3p3 wp=1.20 lp=0.28 np=1 mp=1  ; pins ND NG NS NB
XXLTS_ZERO BD_ZERO
XXLTS_UPRT BD_UPRT
.ends gfm_pinv

* 500 MHz
.tran 0 120e-9 0 5e-12 uic
.lib models_gfmcu.lib
.lib dmodels_analog.lib
.backanno
.end